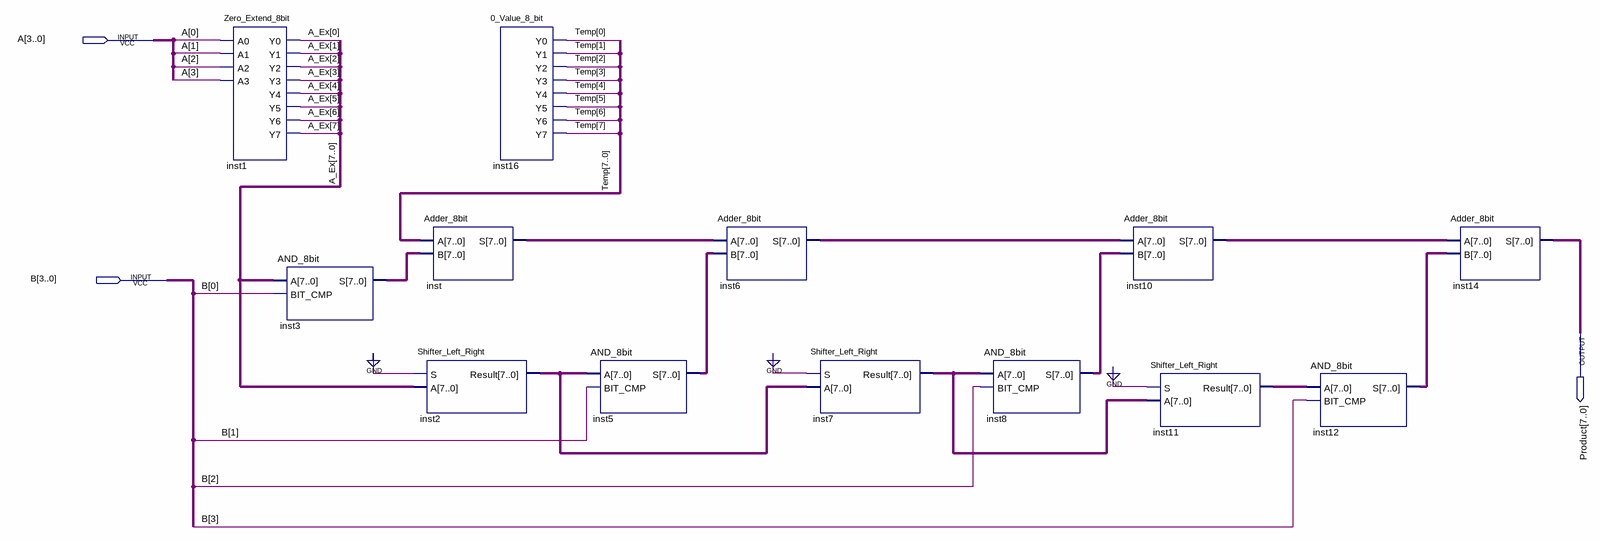
[diagram p0: schematic sheet]
// Quartus schematic Multiplication_4_bit.bdf as structural Verilog: 13 symbols, 3 pins
module Multiplication_4_bit (
  input  [3:0] A,
  input  [3:0] B,
  output [7:0] Product
);

  wire [7:0] A_Ex, inst2_result, inst3_s, inst5_s, inst6_s, inst7_result, inst8_s, inst10_s, inst11_result,
       inst12_s, inst_s, Temp;

  Zero_Extend_8bit inst1 (
    .A0(A[0]), .A1(A[1]), .A2(A[2]), .A3(A[3]), .Y0(A_Ex[0]), .Y1(A_Ex[1]), .Y2(A_Ex[2]), .Y3(A_Ex[3]),
    .Y4(A_Ex[4]), .Y5(A_Ex[5]), .Y6(A_Ex[6]), .Y7(A_Ex[7]));
  AND_8bit inst3 (.A(A_Ex), .BIT_CMP(B[0]), .S(inst3_s));
  Adder_8bit inst (.A(Temp), .B(inst3_s), .S(inst_s));
  Shifter_Left_Right inst2 (.S(1'b0), .A(A_Ex), .Result(inst2_result));
  \0_Value_8_bit  inst16 (
    .Y0(Temp[0]), .Y1(Temp[1]), .Y2(Temp[2]), .Y3(Temp[3]), .Y4(Temp[4]), .Y5(Temp[5]), .Y6(Temp[6]),
    .Y7(Temp[7]));
  AND_8bit inst5 (.A(inst2_result), .BIT_CMP(B[1]), .S(inst5_s));
  Adder_8bit inst6 (.A(inst_s), .B(inst5_s), .S(inst6_s));
  Shifter_Left_Right inst7 (.S(1'b0), .A(inst2_result), .Result(inst7_result));
  AND_8bit inst8 (.A(inst7_result), .BIT_CMP(B[2]), .S(inst8_s));
  Adder_8bit inst10 (.A(inst6_s), .B(inst8_s), .S(inst10_s));
  Shifter_Left_Right inst11 (.S(1'b0), .A(inst7_result), .Result(inst11_result));
  AND_8bit inst12 (.A(inst11_result), .BIT_CMP(B[3]), .S(inst12_s));
  Adder_8bit inst14 (.A(inst10_s), .B(inst12_s), .S(Product));
endmodule
